# Altium schematic sheet 03_MCU_ESP32P4.SchDoc: MCU_ESP32P4
size A3; SheetNumber: 4; SheetTotal: 12
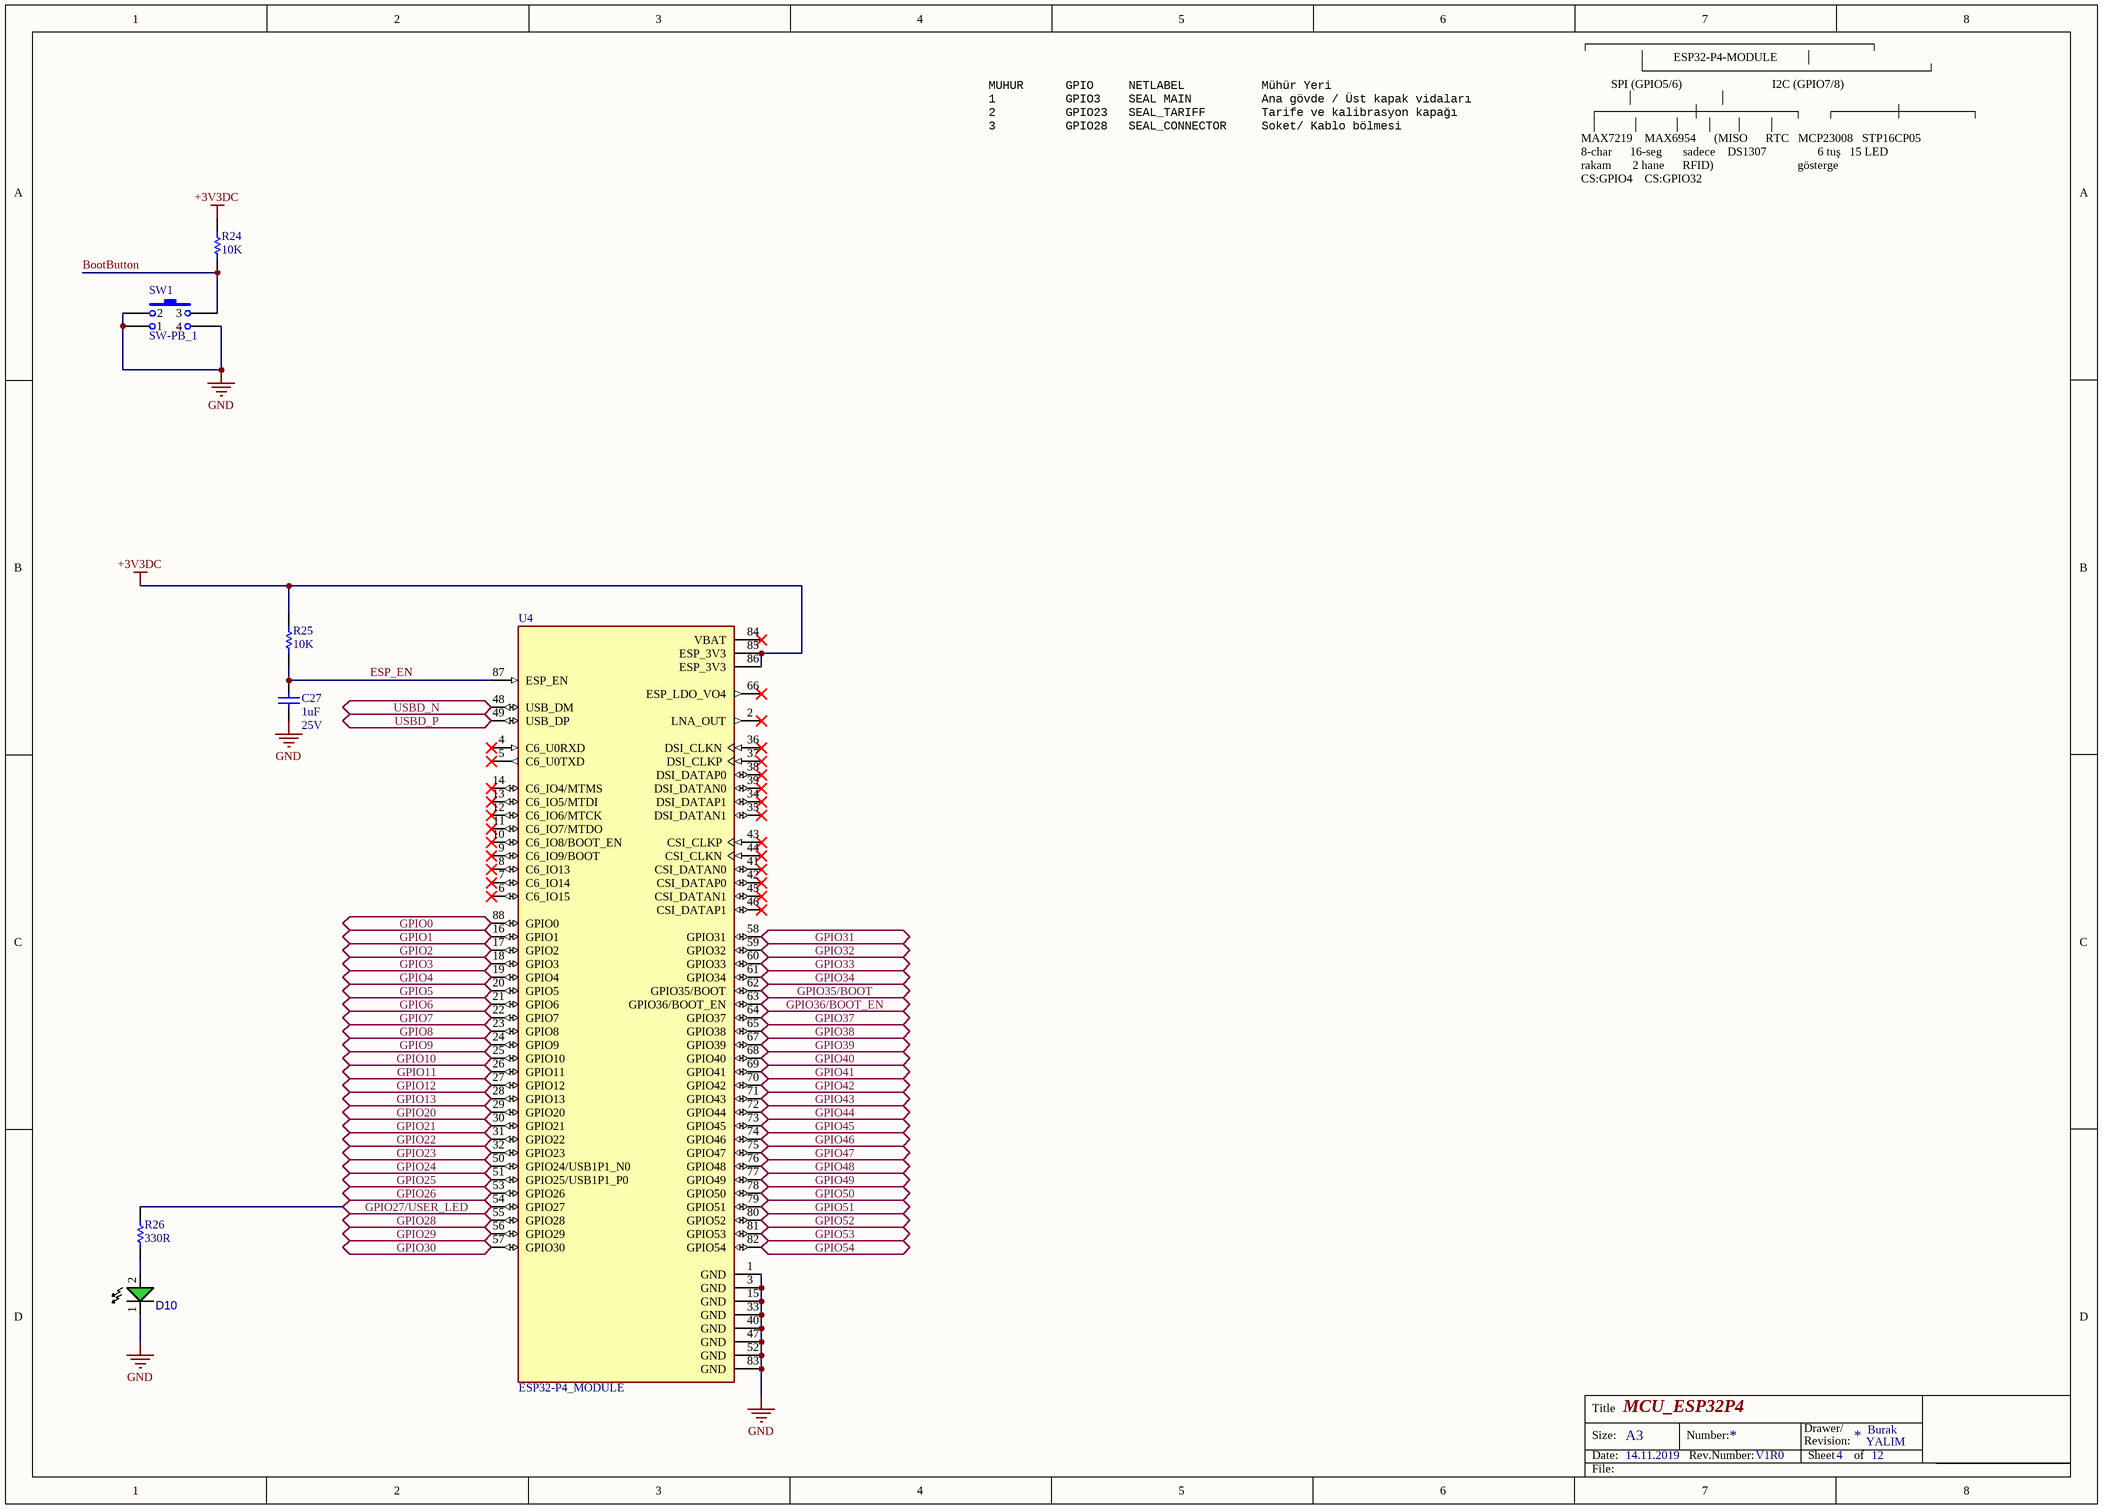
[diagram p0: 03_MCU_ESP32P4.SchDoc]

## Parts
C27  value 1uF  Voltage: 25V  [CAP_0603]  (hidden comment: CL10A105KA8NNNC)
D10  LTST-C190TGKT  [LED_0603_GREEN]  (value not drawn)
R24  value 10K  [RES_0402]  (hidden comment: RC0402JR-0710KL)
R25  value 10K  [RES_0402]  (hidden comment: RC0402JR-0710KL)
R26  value 330R  [RES_0603]  (hidden comment: 0603SAF3300T5E)
SW1  SW-PB_1  [RA_TACT_SWITCH]
U4  ESP32-P4_MODULE  [XCVR_ESP32-P4_MODULE]

## Ports
GPIO0 (bidir), GPIO1 (bidir), GPIO2 (bidir), GPIO3 (bidir), GPIO4 (bidir), GPIO5 (bidir), GPIO6 (bidir), GPIO7 (bidir), GPIO8 (bidir), GPIO9 (bidir), GPIO10 (bidir), GPIO11 (bidir), GPIO12 (bidir), GPIO13 (bidir), GPIO20 (bidir), GPIO21 (bidir), GPIO22 (bidir), GPIO23 (bidir), GPIO24 (bidir), GPIO25 (bidir), GPIO26 (bidir), GPIO27/USER_LED (bidir), GPIO28 (bidir), GPIO29 (bidir), GPIO30 (bidir), GPIO31 (bidir), GPIO32 (bidir), GPIO33 (bidir), GPIO34 (bidir), GPIO35/BOOT (bidir), GPIO36/BOOT_EN (bidir), GPIO37 (bidir), GPIO38 (bidir), GPIO39 (bidir), GPIO40 (bidir), GPIO41 (bidir), GPIO42 (bidir), GPIO43 (bidir), GPIO44 (bidir), GPIO45 (bidir), GPIO46 (bidir), GPIO47 (bidir), GPIO48 (bidir), GPIO49 (bidir), GPIO50 (bidir), GPIO51 (bidir), GPIO52 (bidir), GPIO53 (bidir), GPIO54 (bidir), USBD_N (bidir), USBD_P (bidir)

## Nets
+3V3DC: R24.2 R25.2 U4.85(ESP_3V3) U4.86(ESP_3V3)
GND: C27.2 D10.1 SW1.1 SW1.2 SW1.4 U4.1(GND) U4.3(GND) U4.15(GND) U4.33(GND) U4.40(GND) U4.47(GND) U4.52(GND) U4.83(GND)
BootButton: R24.1 SW1.3
ESP_EN: C27.1 R25.1 U4.87(ESP_EN)
GPIO0: U4.88(GPIO0) ; port GPIO0
GPIO1: U4.16(GPIO1) ; port GPIO1
GPIO2: U4.17(GPIO2) ; port GPIO2
GPIO3: U4.18(GPIO3) ; port GPIO3
GPIO4: U4.19(GPIO4) ; port GPIO4
GPIO5: U4.20(GPIO5) ; port GPIO5
GPIO6: U4.21(GPIO6) ; port GPIO6
GPIO7: U4.22(GPIO7) ; port GPIO7
GPIO8: U4.23(GPIO8) ; port GPIO8
GPIO9: U4.24(GPIO9) ; port GPIO9
GPIO10: U4.25(GPIO10) ; port GPIO10
GPIO11: U4.26(GPIO11) ; port GPIO11
GPIO12: U4.27(GPIO12) ; port GPIO12
GPIO13: U4.28(GPIO13) ; port GPIO13
GPIO20: U4.29(GPIO20) ; port GPIO20
GPIO21: U4.30(GPIO21) ; port GPIO21
GPIO22: U4.31(GPIO22) ; port GPIO22
GPIO23: U4.32(GPIO23) ; port GPIO23
GPIO24: U4.50(GPIO24/USB1P1_N0) ; port GPIO24
GPIO25: U4.51(GPIO25/USB1P1_P0) ; port GPIO25
GPIO26: U4.53(GPIO26) ; port GPIO26
GPIO27/USER_LED: R26.2 U4.54(GPIO27) ; port GPIO27/USER_LED
GPIO28: U4.55(GPIO28) ; port GPIO28
GPIO29: U4.56(GPIO29) ; port GPIO29
GPIO30: U4.57(GPIO30) ; port GPIO30
GPIO31: U4.58(GPIO31) ; port GPIO31
GPIO32: U4.59(GPIO32) ; port GPIO32
GPIO33: U4.60(GPIO33) ; port GPIO33
GPIO34: U4.61(GPIO34) ; port GPIO34
GPIO35/BOOT: U4.62(GPIO35/BOOT) ; port GPIO35/BOOT
GPIO36/BOOT_EN: U4.63(GPIO36/BOOT_EN) ; port GPIO36/BOOT_EN
GPIO37: U4.64(GPIO37) ; port GPIO37
GPIO38: U4.65(GPIO38) ; port GPIO38
GPIO39: U4.67(GPIO39) ; port GPIO39
GPIO40: U4.68(GPIO40) ; port GPIO40
GPIO41: U4.69(GPIO41) ; port GPIO41
GPIO42: U4.70(GPIO42) ; port GPIO42
GPIO43: U4.71(GPIO43) ; port GPIO43
GPIO44: U4.72(GPIO44) ; port GPIO44
GPIO45: U4.73(GPIO45) ; port GPIO45
GPIO46: U4.74(GPIO46) ; port GPIO46
GPIO47: U4.75(GPIO47) ; port GPIO47
GPIO48: U4.76(GPIO48) ; port GPIO48
GPIO49: U4.77(GPIO49) ; port GPIO49
GPIO50: U4.78(GPIO50) ; port GPIO50
GPIO51: U4.79(GPIO51) ; port GPIO51
GPIO52: U4.80(GPIO52) ; port GPIO52
GPIO53: U4.81(GPIO53) ; port GPIO53
GPIO54: U4.82(GPIO54) ; port GPIO54
USBD_N: U4.48(USB_DM) ; port USBD_N
USBD_P: U4.49(USB_DP) ; port USBD_P
NetD10_2: D10.2 R26.1

Not connected (* = marked no-connect by the designer): U4 2(LNA_OUT)* 4(C6_U0RXD)* 5(C6_U0TXD)* 6(C6_IO15)* 7(C6_IO14)* 8(C6_IO13)* 9(C6_IO9/BOOT)* 10(C6_IO8/BOOT_EN)* 11(C6_IO7/MTDO)* 12(C6_IO6/MTCK)* 13(C6_IO5/MTDI)* 14(C6_IO4/MTMS)* 34(DSI_DATAP1)* 35(DSI_DATAN1)* 36(DSI_CLKN)* 37(DSI_CLKP)* 38(DSI_DATAP0)* 39(DSI_DATAN0)* 41(CSI_DATAN0)* 42(CSI_DATAP0)* 43(CSI_CLKP)* 44(CSI_CLKN)* 45(CSI_DATAN1)* 46(CSI_DATAP1)* 66(ESP_LDO_VO4)* 84(VBAT)*

## Notes on the sheet
- MUHUR      GPIO     NETLABEL           Mühür Yeri
  1          GPIO3    SEAL MAIN          Ana gövde / Üst kapak vidaları
  2          GPIO23   SEAL_TARIFF        Tarife ve kalibrasyon kapağı
  3          GPIO28   SEAL_CONNECTOR     Soket/ Kablo bölmesi
- ┌─────────────────────────────────┐
  │         ESP32-P4-MODULE         │
  └─────────────────────────────────┘
  SPI (GPIO5/6)                              I2C (GPIO7/8)
  │                            │
  ┌───────────┼───────────┐        ┌───────┼────────┐
  │           │           │        │       │        │
  MAX7219    MAX6954      (MISO      RTC   MCP23008   STP16CP05
  8-char      16-seg       sadece    DS1307                 6 tuş   15 LED
  rakam       2 hane      RFID)                            gösterge
  CS:GPIO4    CS:GPIO32
- Title
- Size:
- Date:
- 14.11.2019
- A3
- Number:
- Rev.Number:
- V1R0
- Revision:
- Drawer/
- Sheet
- of
- YALIM
- Burak
- File:

## Library data of the parts
C27 = C01757: CAP CER 1UF 25VDC %10 X5R SMD; Manufacturer: Samsung; Manufacturer Part Number: CL10A105KA8NNNC
D10 = LTST-C190TGKT: LED SMD 0603 GREEN 71-450mcd 130° WATER CLEAR; Manufacturer: LITEON; Package: 0603(1608 Metric); Manufacturer Part Number: LTST-C190TGKT; Value: GREEN
R24 R25 = R03000: RES.(1005) 0402 10K Ohms 5% 1/16W 100PPM SMT; Manufacturer: YAGEO; Manufacturer Part Number: RC0402JR-0710KL
R26 = 0603SAF3300T5E: RES.(1608) 0603 330 Ohms 1% 1/10W-S 100PPM; Manufacturer: ROYALOHM; Supplier 1: Ozdisan; Manufacturer Part Number: 0603SAF3300T5E
SW1 = SW-PB_1: Switch; Part Number: TC-0203T-A00; Unit: USD; Published: 24-Mar-1999; Ordering: https://www.ozdisan.com/elektromekanik-komponentler/sivicler-anahtarlar/tact-sivicler/TC-0203T-A00; Publisher: Altium Limited; Price: 0,06795
U4 = ESP32-P4_MODULE: Dual-core RISC-V high-performance module ESP32-C6H8; Manufacturer: Waveshare Electronics; Manufacturer Part Number: ESP32-P4 Module; Value: *